# Altium schematic sheet Controller_Section.SchDoc
size A4
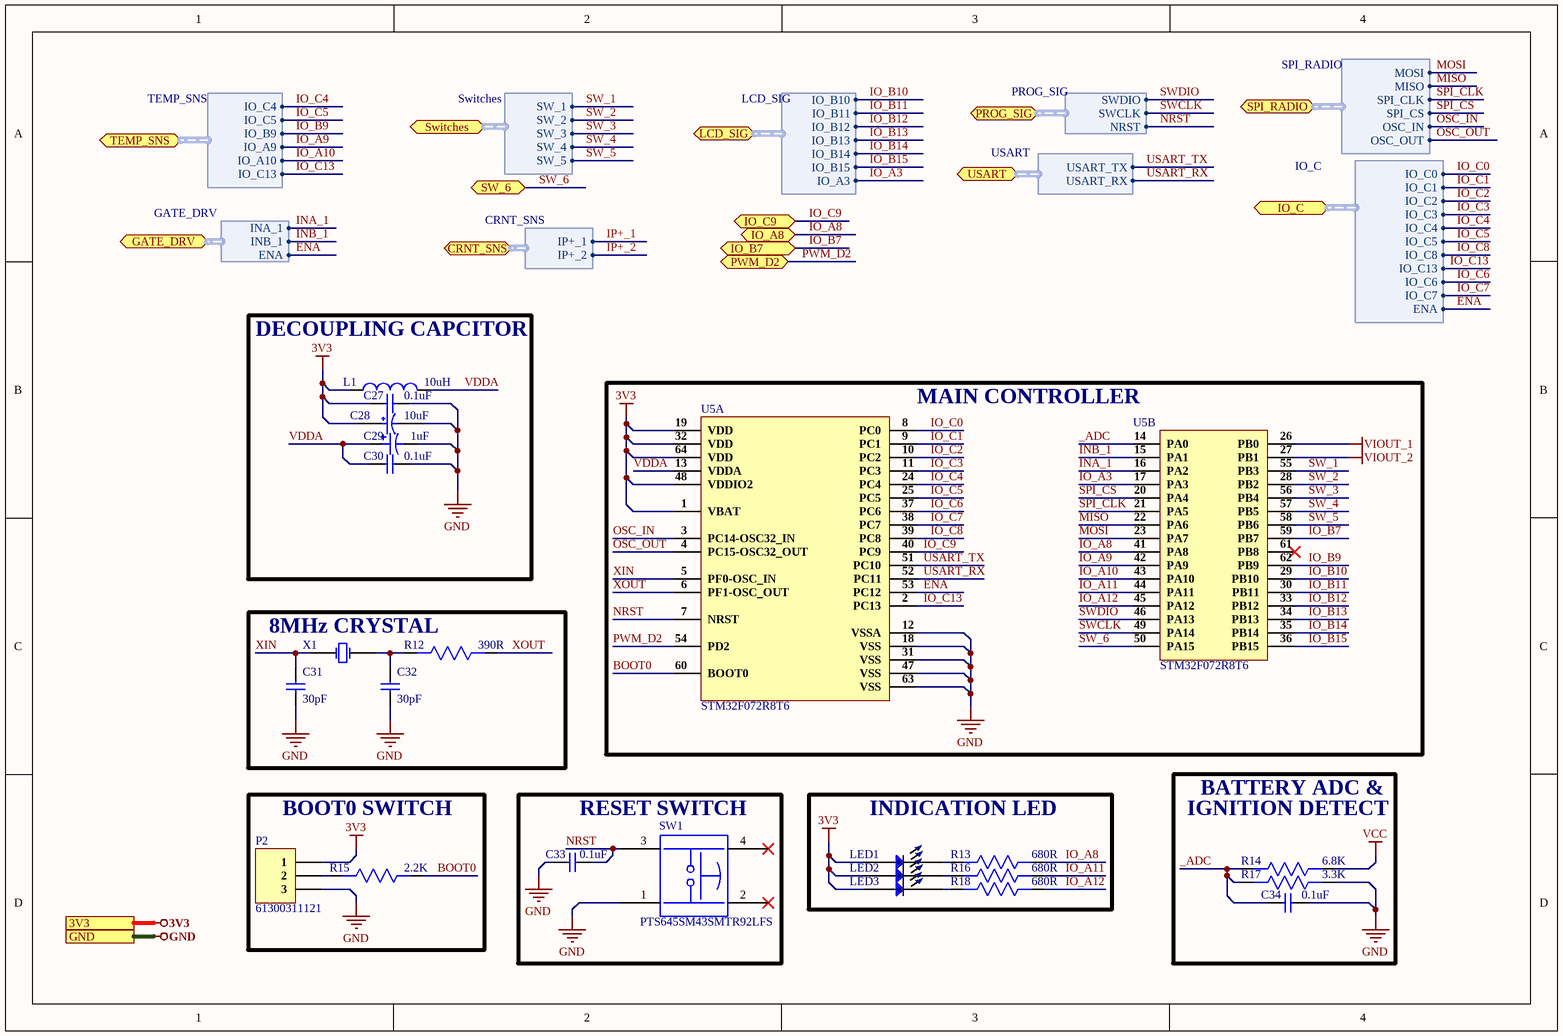
[diagram p0: Controller_Section.SchDoc]

## Parts
C27  0.1uF  [Cap0603]
C28  10uF  [RVT1E100M0405.]
C29  1uF  [F981E105MMA]
C30  0.1uF  [Cap0603]
C31  30pF  [Cap0603]
C32  30pF  [Cap0603]
C33  0.1uF  [Cap0603]
C34  0.1uF  [Cap0603]
L1  10uH  [Ind0805]
LED1  XZMDK68W-2  [LED 0402]  (value not drawn)
LED2  XZMDK68W-2  [LED 0402]  (value not drawn)
LED3  XZMDK68W-2  [LED 0402]  (value not drawn)
P2  61300311121  [HDR1X3]
R12  390R  [RES-0603]
R13  680R  [RES-0603]
R14  6.8K  [RES-0603]
R15  2.2K  [RES-0603]
R16  680R  [RES-0603]
R17  3.3K  [RES-0603]
R18  680R  [RES-0603]
SW1  PTS645SM43SMTR92LFS  [PTS645SM43SMTR92LFS]
U5  STM32F072R8T6  [64LQFP (10X10)]  (parts A,B of 2)
X1  9C-8.000MEEJ-T  [9C-8.000MEEJ-T]  (value not drawn)

## Blocks framed on the sheet
DECOUPLING CAPCITOR: C27-C30 L1
MAIN CONTROLLER: U5
8MHz CRYSTAL: C31 C32 R12 X1
BOOT0 SWITCH: P2 R15
RESET SWITCH: C33 SW1
INDICATION LED: LED1-LED3 R13 R16 R18

## Ports
3V3, CRNT_SNS (bidir, harness CRNT_SNS), GATE_DRV (bidir, harness GATE_DRV), GND, IO_A8 (bidir), IO_B7 (bidir), IO_C9 (bidir), IO_C (bidir, harness IO_C), LCD_SIG (bidir, harness LCD_SIG), PROG_SIG (bidir, harness PROG_SIG), PWM_D2 (bidir), SPI_RADIO (bidir, harness SPI_RADIO), SW_6 (bidir), Switches (bidir, harness Switches), TEMP_SNS (bidir, harness TEMP_SNS), USART (bidir, harness USART)

## Harnesses
Switches: SW_1, SW_2, SW_3, SW_4, SW_5
LCD_SIG: IO_B10, IO_B11, IO_B12, IO_B13, IO_B14, IO_B15, IO_A3
PROG_SIG: SWDIO, SWCLK, NRST
USART: USART_TX, USART_RX
CRNT_SNS: IP+_1, IP+_2
GATE_DRV: INA_1, INB_1, ENA
SPI_RADIO: SPI_CLK, MOSI, OSC_OUT, MISO, OSC_IN, SPI_CS
TEMP_SNS: IO_C4, IO_C5, IO_B9, IO_A9, IO_A10, IO_C13
IO_C: IO_C2, IO_C0, IO_C5, IO_C1, IO_C4, IO_C3, IO_C8, IO_C13, IO_C6, IO_C7, ENA

## Nets
3V3: C27.1 C28.1 L1.1 LED1.1 LED2.1 LED3.1 P2.1 U5.1(VBAT) U5.19(VDD) U5.32(VDD) U5.48(VDDIO2) U5.64(VDD) ; port 3V3
GND: C27.2 C28.2 C29.2 C30.2 C31.1 C32.1 C33.2 C34.2 P2.3 R17.1 SW1.1 U5.12(VSSA) U5.18(VSS) U5.31(VSS) U5.47(VSS) U5.63(VSS) ; port GND
VCC: R14.1
VIOUT_1: U5.26(PB0)
VIOUT_2: U5.27(PB1)
_ADC: C34.1 R14.2 R17.2 U5.14(PA0)
BOOT0: R15.1 U5.60(BOOT0)
ENA: U5.53(PC12) ; port GATE_DRV.ENA, port IO_C.ENA
INA_1: U5.16(PA2) ; port GATE_DRV.INA_1
INB_1: U5.15(PA1) ; port GATE_DRV.INB_1
IO_A3: U5.17(PA3) ; port LCD_SIG.IO_A3
IO_A8: R13.1 U5.41(PA8) ; port IO_A8
IO_A9: U5.42(PA9) ; port TEMP_SNS.IO_A9
IO_A10: U5.43(PA10) ; port TEMP_SNS.IO_A10
IO_A11: R16.1 U5.44(PA11)
IO_A12: R18.1 U5.45(PA12)
IO_B7: U5.59(PB7) ; port IO_B7
IO_B9: U5.62(PB9) ; port TEMP_SNS.IO_B9
IO_B10: U5.29(PB10) ; port LCD_SIG.IO_B10
IO_B11: U5.30(PB11) ; port LCD_SIG.IO_B11
IO_B12: U5.33(PB12) ; port LCD_SIG.IO_B12
IO_B13: U5.34(PB13) ; port LCD_SIG.IO_B13
IO_B14: U5.35(PB14) ; port LCD_SIG.IO_B14
IO_B15: U5.36(PB15) ; port LCD_SIG.IO_B15
IO_C0: U5.8(PC0) ; port IO_C.IO_C0
IO_C1: U5.9(PC1) ; port IO_C.IO_C1
IO_C2: U5.10(PC2) ; port IO_C.IO_C2
IO_C3: U5.11(PC3) ; port IO_C.IO_C3
IO_C4: U5.24(PC4) ; port TEMP_SNS.IO_C4, port IO_C.IO_C4
IO_C5: U5.25(PC5) ; port TEMP_SNS.IO_C5, port IO_C.IO_C5
IO_C6: U5.37(PC6) ; port IO_C.IO_C6
IO_C7: U5.38(PC7) ; port IO_C.IO_C7
IO_C8: U5.39(PC8) ; port IO_C.IO_C8
IO_C9: U5.40(PC9) ; port IO_C9
IO_C13: U5.2(PC13) ; port TEMP_SNS.IO_C13, port IO_C.IO_C13
IP+_1: port CRNT_SNS.IP+_1
IP+_2: port CRNT_SNS.IP+_2
MISO: U5.22(PA6) ; port SPI_RADIO.MISO
MOSI: U5.23(PA7) ; port SPI_RADIO.MOSI
NRST: C33.1 SW1.3 U5.7(NRST) ; port PROG_SIG.NRST
OSC_IN: U5.3(PC14-OSC32_IN) ; port SPI_RADIO.OSC_IN
OSC_OUT: U5.4(PC15-OSC32_OUT) ; port SPI_RADIO.OSC_OUT
PWM_D2: U5.54(PD2) ; port PWM_D2
SPI_CLK: U5.21(PA5) ; port SPI_RADIO.SPI_CLK
SPI_CS: U5.20(PA4) ; port SPI_RADIO.SPI_CS
SW_1: U5.55(PB3) ; port Switches.SW_1
SW_2: U5.28(PB2) ; port Switches.SW_2
SW_3: U5.56(PB4) ; port Switches.SW_3
SW_4: U5.57(PB5) ; port Switches.SW_4
SW_5: U5.58(PB6) ; port Switches.SW_5
SW_6: U5.50(PA15) ; port SW_6
SWCLK: U5.49(PA14) ; port PROG_SIG.SWCLK
SWDIO: U5.46(PA13) ; port PROG_SIG.SWDIO
USART_RX: U5.52(PC11) ; port USART.USART_RX
USART_TX: U5.51(PC10) ; port USART.USART_TX
VDDA: C29.1 C30.1 L1.2 U5.13(VDDA)
XIN: C31.2 U5.5(PF0-OSC_IN) X1.1(OSC1)
XOUT: R12.1 U5.6(PF1-OSC_OUT)
NetC32_2: C32.2 R12.2 X1.2(OSC2)
NetLED1_2: LED1.2 R13.2
NetLED2_2: LED2.2 R16.2
NetLED3_2: LED3.2 R18.2
NetP2_2: P2.2 R15.2

Not connected (* = marked no-connect by the designer): SW1 2* 4*; U5 61(PB8)*

## Notes on the sheet
- IGNITION DETECT
- BATTERY ADC &

## Library data of the parts
C27 C30 C33 C34 = CC0603ZRY5V9BB104: CAP CER 0.1UF 50V Y5V 0603; Manufacturer: Yageo; Capacitance: 100nF; Tolerance: 80%; Supplier 1: Digi-Key; Manufacturer Part Number: CC0603ZRY5V9BB104; Stock 1: 15000880; Pricing 1: 1=0.1, 10=0.075, 100=0.0334, 500=0.02386, 1000=0.01874 (USD); Mount: Surface Mount; Case/Package: 0603; Number of Pins: 2; Case Code (Metric): 1608; Case Code (Imperial): 0603; Min Operating Temperature: -30°C; Max Operating Temperature: 85°C; Dielectric: Y5V; Voltage Rating: 50V; Package Quantity: 1; Packaging: Tape and Reel; Voltage Rating (DC): 50V; Termination: SMD/SMT; Composition: Ceramic; Voltage: 50V; Length: 1.6mm; Height: 0.8mm; Width: 0.031inch; Thickness: 0.035inch; Depth: 0.8mm; Radiation Hardening: No; REACH SVHC: No SVHC; Lead Free: Lead Free; Halogen Free: Halogen Free; ComponentLink1URL: http://www.yageo.com/documents/recent/UPY-GPHC_Y5V_6.3V-to-50V_8.pdf?src-supplier=Digi-Key; ComponentLink1Description: http://www.yageo.com/documents/recent/UPY-GPHC_Y5V_6.3V-to-50V_8.pdf?src-supplier=Digi-Key; ComponentLink2URL: http://www.yageo.com/documents/recent/UPY-GPHC_Y5V_6.3V-to-50V_5.pdf?src-supplier=Avnet+Europe; ComponentLink2Description: http://www.yageo.com/documents/recent/UPY-GPHC_Y5V_6.3V-to-50V_5.pdf?src-supplier=Avnet+Europe; ComponentLink3URL: https://www.verical.com/server-webapp/html/getDatasheet?partID=403611&src-supplier=Verical; ComponentLink3Description: https://www.verical.com/server-webapp/html/getDatasheet?partID=403611&src-supplier=Verical; ComponentLink4URL: http://www.mouser.com/ds/2/447/Yageo_UPY-GP_NP0_16V-to-50V_9-358835.pdf?src-supplier=Mouser; ComponentLink4Description: http://www.mouser.com/ds/2/447/Yageo_UPY-GP_NP0_16V-to-50V_9-358835.pdf?src-supplier=Mouser; ComponentLink5URL: http://www.farnell.com/datasheets/1132289.pdf?src-supplier=Element14; ComponentLink5Description: http://www.farnell.com/datasheets/1132289.pdf?src-supplier=Element14; Supplier Part Number 1: 311-1343-1-ND
C28 = RVT1E100M0405: CAP ALUM 10uF 25V SMD; Manufacturer: ROQANG; φD: 4mm; L: 5.4mm; Tolerance: ±20%; Operating Temperature: -45℃~+105℃; Rated Voltage: 25V; Capacitance: 10uF
C29 = F981E105MMA: CAP TANT 1UF 20% 25V 0603; Manufacturer: Kyocera AVX; ESR (Equivalent Series Resistance): 10R; Supplier 1: Digi-Key; Manufacturer Part Number: F981E105MMA; RoHS: Yes; Category: Tantalum Capacitors; Stock 1: 11167; Pricing 1: 1=0.79000, 10=0.55800, 50=0.42220, 100=0.36770, 500=0.27236, 1000=0.23151 (USD); Mount: Surface Mount; Case/Package: 0603; Min Operating Temperature: -55°C; Max Operating Temperature: 125°C; Features: General Purpose; Packaging: Tape and Reel; Capacitance: 1uF; Tolerance: 20%; Voltage Rating: 25V; RoHS Compliant: Yes; ComponentLink1URL: http://www.mouser.com/ds/2/40/f98-775787.pdf?src-supplier=Mouser; ComponentLink1Description: http://www.mouser.com/ds/2/40/f98-775787.pdf?src-supplier=Mouser; ComponentLink2URL: http://www.farnell.com/datasheets/2096554.pdf?src-supplier=Newark; ComponentLink2Description: http://www.farnell.com/datasheets/2096554.pdf?src-supplier=Newark; ComponentLink3URL: http://datasheets.avx.com/F98.pdf?src-supplier=Digi-Key; ComponentLink3Description: http://datasheets.avx.com/F98.pdf?src-supplier=Digi-Key; Supplier Part Number 1: 478-8658-1-ND
C31 C32 = CC0603JRNPO9BN300: CAP 30pF NP0 0603 50 V ±5 % SMD; Manufacturer: Yageo; Tolerance: 5%; Dielectric: C0G; Voltage Rating: 50V; Dissipation Factor: 0.1%; Insulation Resistance: 10GR; Supplier 1: Digi-Key; Manufacturer Part Number: CC0603JRNPO9BN300; RoHS: Yes; Category: Ceramic Capacitors; Stock 1: 36700; Pricing 1: 1=0.10000, 10=0.06800, 50=0.03700, 100=0.03020, 500=0.02160, 1000=0.01697 (USD); Mount: Surface Mount; Case/Package: 0603; Number of Pins: 2; Case Code (Imperial): 0603; Case Code (Metric): 1608; Weight: 7.1E-05oz; Min Operating Temperature: -55°C; Max Operating Temperature: 125°C; Capacitance: 30pF; Packaging: Tape and Reel; Voltage Rating (DC): 50V; Termination: SMD/SMT; Resistor Type: Ceramic; Series: CC; Construction: Flat; Length: 1.6mm; Width: 0.031inch; Height: 0.8mm; Thickness: 0.035inch; Depth: 0.8mm; Radiation Hardening: No; REACH SVHC: No SVHC; Lead Free: Lead Free; RoHS Compliant: Yes; ComponentLink1URL: https://datasheet.ciiva.com/26862/getdatasheetpartid-403531-26862766.pdf?src-supplier=Verical; ComponentLink1Description: https://datasheet.ciiva.com/26862/getdatasheetpartid-403531-26862766.pdf?src-supplier=Verical; ComponentLink2URL: https://datasheet.ciiva.com/13264/upy-gp-np0-16v-to-50v-8-3714-13264406.pdf?src-supplier=Mouser; ComponentLink2Description: https://datasheet.ciiva.com/13264/upy-gp-np0-16v-to-50v-8-3714-13264406.pdf?src-supplier=Mouser; ComponentLink3URL: https://datasheet.ciiva.com/7978/1132289-7978140.pdf?src-supplier=Element14; ComponentLink3Description: https://datasheet.ciiva.com/7978/1132289-7978140.pdf?src-supplier=Element14; ComponentLink4URL: https://datasheet.ciiva.com/28450/1443161-28450494.pdf?src-supplier=Element14; ComponentLink4Description: https://datasheet.ciiva.com/28450/1443161-28450494.pdf?src-supplier=Element14; Supplier Part Number 1: 311-3357-1-ND
L1 = MGFL2012F100MT-LF: 500mA 10uH ±20% 320mΩ 0805 Inductors; Manufacturer: Microgate; Manufacturer Part No:: MGFL2012F100MT-LF; Value: 10uH; Package: 0805; ComponentLink1Description: New link; ComponentLink1URL: https://lcsc.com/product-detail/Inductors-SMD_microgate-MGFL2012F100MT-LF_C281113.html
LED1-LED3 = XZMDK68W-2: LED RED CLEAR CHIP SMD; Manufacturer: SunLED; Lens Color: Colorless; Luminous Intensity: 69mcd; Test Current: 20mA; Viewing Angle: 120°; Dominant Wavelength: 630nm; Forward Voltage: 1.95V; Supplier 1: Digi-Key; Manufacturer Part Number: XZMDK68W-2; Stock 1: 69539; Pricing 1: 1=0.43, 10=0.306, 100=0.136, 500=0.0952, 1000=0.0782 (USD); Mount: Surface Mount; Case/Package: 0402; Color: Red; Case Code (Metric): 1005; Case Code (Imperial): 0402; Packaging: Tape and Reel; Lens Transparency: Clear; Length: 1mm; Height: 0.6mm; Width: 0.5mm; ComponentLink1URL: http://www.sunledusa.com/products/spec/XZMDK68W-2.pdf?src-supplier=Digi-Key; ComponentLink1Description: http://www.sunledusa.com/products/spec/XZMDK68W-2.pdf?src-supplier=Digi-Key; ComponentLink2URL: https://www.sunledusa.com/products/spec/XZMDK68W-2.pdf?src-supplier=Digi-Key; ComponentLink2Description: https://www.sunledusa.com/products/spec/XZMDK68W-2.pdf?src-supplier=Digi-Key; Supplier Part Number 1: 1497-1174-6-ND
P2 = Header 1X3: CONN HEADER VERT 3POS 2.54MM; Manufacturer: Wurth Electronics; Number of Positions: 3; Gender: Male; Connector Type: Male Pin; Pitch: 0.1inch; Supplier 1: Digi-Key; Manufacturer Part Number: 61300311121; Stock 1: 81286; Pricing 1: 1=0.13, 10=0.106, 25=0.088, 50=0.074, 100=0.067, 1000=0.061 (USD); Mount: Through Hole; Contact Plating: Gold; Contact Material: Copper; Color: Black; Number of Rows: 1; Packaging: Bulk; Termination: Solder; Number of Contacts: 3; Contact Mating Length: 0.236inch; REACH SVHC: Unknown; Lead Free: Lead Free; ComponentLink1URL: http://www.farnell.com/cad/1737268.pdf?src-supplier=Element14; ComponentLink1Description: http://www.farnell.com/cad/1737268.pdf?src-supplier=Element14; ComponentLink2URL: https://katalog.we-online.de/em/datasheet/6130xx11121.pdf?src-supplier=Digi-Key; ComponentLink2Description: https://katalog.we-online.de/em/datasheet/6130xx11121.pdf?src-supplier=Digi-Key; Supplier Part Number 1: 732-5316-ND
R12 = RC0603JR-07390RL: RES SMD 390 OHM 5% 1/10W 0603; Manufacturer: Yageo; Voltage Rating: 50V; Power Rating: 100mW; Temperature Coefficient: 100ppm/°C; Working Voltage: 75V; Supplier 1: Digi-Key; Manufacturer Part Number: RC0603JR-07390RL; Stock 1: 1598874; Pricing 1: 1=0.1, 10=0.02, 100=0.0081, 1000=0.00362, 2500=0.00314 (USD); Case/Package: 0603; Number of Pins: 2; Case Code (Imperial): 0603; Case Code (Metric): 1608; Min Operating Temperature: -55°C; Max Operating Temperature: 155°C; Voltage Rating (DC): 50V; Resistance: 390R; Tolerance: 5%; Packaging: Tape and Reel; Package Quantity: 1; Termination: SMD/SMT; Composition: Thick Film; Number of Terminations: 2; Military Standard: Not; Max Power Dissipation: 100mW; Features: Moisture Resistant; Length: 1.6mm; Height: 0.022inch; Width: 0.8mm; Depth: 0.8mm; REACH SVHC: No SVHC; Lead Free: Lead Free; ComponentLink1URL: http://www.yageo.com.tw/exep/pages/download/literatures/PYu-R_INT-thick_7.pdf?src-supplier=Digi-Key; ComponentLink1Description: http://www.yageo.com.tw/exep/pages/download/literatures/PYu-R_INT-thick_7.pdf?src-supplier=Digi-Key; ComponentLink2URL: http://www.yageo.com/documents/recent/PYu-RC_Group_51_RoHS_L_10.pdf?src-supplier=Digi-Key; ComponentLink2Description: http://www.yageo.com/documents/recent/PYu-RC_Group_51_RoHS_L_10.pdf?src-supplier=Digi-Key; ComponentLink3URL: http://www.yageo.com/documents/recent/PYu-RC_Group_51_RoHS_L_9.pdf?src-supplier=Digi-Key; ComponentLink3Description: http://www.yageo.com/documents/recent/PYu-RC_Group_51_RoHS_L_9.pdf?src-supplier=Digi-Key; ComponentLink4URL: http://www.farnell.com/datasheets/443971.pdf?src-supplier=Element14; ComponentLink4Description: http://www.farnell.com/datasheets/443971.pdf?src-supplier=Element14; Supplier Part Number 1: 311-390GRCT-ND
R13 R16 R18 = RC0603FR-07680RL: RES SMD 680 OHM 1% 1/10W 0603; Manufacturer: Yageo; Temperature Coefficient: 100ppm/°C; Voltage Rating (DC): 50V; Power Rating: 100mW; Supplier 1: Digi-Key; Manufacturer Part Number: RC0603FR-07680RL; Stock 1: 4278227; Pricing 1: 1=0.1, 10=0.024, 100=0.0097, 1000=0.00437, 2500=0.00379 (USD); Case/Package: 0603; Number of Pins: 2; Case Code (Imperial): 0603; Case Code (Metric): 1608; Min Operating Temperature: -55°C; Max Operating Temperature: 155°C; Resistance: 680R; Tolerance: 1%; Composition: Thick Film; Packaging: Tape and Reel; Number of Terminations: 2; Military Standard: Not; Voltage Rating: 50V; Package Quantity: 1; Termination: SMD/SMT; Max Power Dissipation: 100mW; Features: Moisture Resistant; Length: 1.6mm; Height: 0.022inch; Width: 0.031inch; Depth: 0.8mm; REACH SVHC: No SVHC; Lead Free: Lead Free; ComponentLink1URL: http://www.farnell.com/datasheets/1868787.pdf?src-supplier=Element14; ComponentLink1Description: http://www.farnell.com/datasheets/1868787.pdf?src-supplier=Element14; ComponentLink2URL: http://documents.rs-components.com/techlib://itc_doclist_GB.htm?stockno=5048221&src-supplier=RSComponents; ComponentLink2Description: http://documents.rs-components.com/techlib://itc_doclist_GB.htm?stockno=5048221&src-supplier=RSComponents; ComponentLink3URL: http://www.farnell.com/datasheets/443971.pdf?src-supplier=Element14; ComponentLink3Description: http://www.farnell.com/datasheets/443971.pdf?src-supplier=Element14; ComponentLink4URL: http://www.yageo.com/documents/recent/PYu-RC_Group_51_RoHS_L_10.pdf?src-supplier=Digi-Key; ComponentLink4Description: http://www.yageo.com/documents/recent/PYu-RC_Group_51_RoHS_L_10.pdf?src-supplier=Digi-Key; Supplier Part Number 1: 311-680HRCT-ND
R14 = CRCW06036K80JNEA: RES SMD 6.8K OHM 5% 1/10W 0603; Manufacturer: Vishay Dale; Resistance: 6.8kR; Power Rating: 100mW; Voltage Rating: 75V; Temperature Coefficient: 200ppm/°C; Supplier 1: Digi-Key; Manufacturer Part Number: CRCW06036K80JNEA; RoHS: Yes; Category: Chip SMD Resistors; Stock 1: 38850; Pricing 1: 1=0.10000, 10=0.03300, 100=0.01360, 1000=0.00610, 2500=0.00529 (USD); Case/Package: 0603; Case Code (Imperial): 0603; Case Code (Metric): 1608; Weight: 7.1E-05oz; Contact Plating: Tin; Size Code: 0603; Min Operating Temperature: -55°C; Max Operating Temperature: 155°C; Tolerance: 5%; Packaging: Tape and Reel; Termination: SMD/SMT; Resistor Type: Thick Film; Series: CRCW; Package Quantity: 1; Number of Terminations: 2; Max Power Dissipation: 100mW; Voltage Rating (DC): 75V; Features: Automotive AEC-Q200; Technology: THICK FILM; Resistance Tolerance: 5%; Construction: Rectangular; Length: 1.55mm; Width: 0.85mm; Height: 0.45mm; Depth: 0.85mm; Radiation Hardening: No; RoHS Compliant: Yes; Lead Free: Lead Free; REACH SVHC: Unknown; Military Standard: Not; ComponentLink1URL: https://datasheet.ciiva.com/2493/dcrcwe3-2493715.pdf?src-supplier=Digi-Key; ComponentLink1Description: https://datasheet.ciiva.com/2493/dcrcwe3-2493715.pdf?src-supplier=Digi-Key; ComponentLink2URL: https://datasheet.ciiva.com/2493/dcrcwe3-2493716.pdf?src-supplier=Digi-Key; ComponentLink2Description: https://datasheet.ciiva.com/2493/dcrcwe3-2493716.pdf?src-supplier=Digi-Key; ComponentLink3URL: https://datasheet.ciiva.com/2493/dcrcwe3-2493717.pdf?src-supplier=Digi-Key; ComponentLink3Description: https://datasheet.ciiva.com/2493/dcrcwe3-2493717.pdf?src-supplier=Digi-Key; ComponentLink4URL: https://datasheet.ciiva.com/28542/1747939-28542618.pdf?src-supplier=Element14; ComponentLink4Description: https://datasheet.ciiva.com/28542/1747939-28542618.pdf?src-supplier=Element14; ComponentLink5URL: https://datasheet.ciiva.com/3257/dcrcwe3-3257854.pdf?src-supplier=Avnet; ComponentLink5Description: https://datasheet.ciiva.com/3257/dcrcwe3-3257854.pdf?src-supplier=Avnet; Supplier Part Number 1: 541-6.8KGCT-ND
R15 = RC0603FR-072K2L: RES SMD 2.2K OHM 1% 1/10W 0603; Manufacturer: Yageo Phycomp; Temperature Coefficient: 100ppm/°C; Resistance: 2.2kR; Power Rating: 100mW; Voltage Rating (DC): 50V; Supplier 1: Digi-Key; Manufacturer Part Number: RC0603FR-072K2L; Stock 1: 10587920; Pricing 1: 1=0.1, 10=0.023, 100=0.0094, 1000=0.00421, 2500=0.00366 (USD); Mount: Surface Mount; Case/Package: 0603; Number of Pins: 2; Min Operating Temperature: -55°C; Max Operating Temperature: 155°C; Tolerance: 1%; Packaging: Cut Tape; Length: 1.6mm; Height: 0.45mm; Width: 800um; Depth: 0.8mm; REACH SVHC: No SVHC; Lead Free: Lead Free; Supplier Part Number 1: 311-2.20KHRCT-ND
R17 = RC0603FR-073K3L: RES SMD 3.3K OHM 1% 1/10W 0603; Manufacturer: Yageo Phycomp; Temperature Coefficient: 100ppm/°C; Resistance: 3.3kR; Voltage Rating (DC): 50V; Power Rating: 100mW; Supplier 1: Digi-Key; Manufacturer Part Number: RC0603FR-073K3L; Stock 1: 6863000; Pricing 1: 1=0.1, 10=0.024, 100=0.0097, 1000=0.00437, 2500=0.00379 (USD); Mount: Surface Mount; Case/Package: 0603; Number of Pins: 2; Min Operating Temperature: -55°C; Max Operating Temperature: 155°C; Tolerance: 1%; Packaging: Cut Tape; Length: 1.6mm; Height: 0.45mm; Width: 800um; Depth: 0.8mm; REACH SVHC: No SVHC; Lead Free: Lead Free; Supplier Part Number 1: 311-3.30KHRCT-ND
SW1 = PTS645SM43SMTR92LFS: SWITCH TACTILE SPST-NO 0.05A 12V; Manufacturer: ITT C&K; Mechanical Life: 100000Cycles; Actuator Material: Nylon,Polyamide,PA66; Throw Configuration: SPST; Operating Force: 160gf; Contact Resistance: 100mR; Max Current Rating: 50mA; Illumination Type: Non-Illuminated,Illuminated; Switch Function: Off-Mom; Actuator Type: Standard; Actuator Length: 0.85mm; Supplier 1: Digi-Key; Manufacturer Part Number: PTS645SM43SMTR92LFS; RoHS: Yes; Category: Tactile Switches; Stock 1: 1002899; Pricing 1: 1=0.26000, 10=0.25100, 25=0.23840, 100=0.21580, 250=0.19676, 500=0.18288 (USD); Mount: Surface Mount; Case/Package: SMD/SMT; Contact Plating: Silver; Contact Material: Silver; Color: Black; Min Operating Temperature: -20°C; Max Operating Temperature: 60°C; Max Voltage Rating (DC): 12V; Packaging: Tape and Reel; Termination: Gull Wing; Package Quantity: 1; Current Rating: 50mA; Voltage Rating (DC): 12V; Orientation: Straight; Series: PTS645; Length: 6mm; Depth: 9mm; Size: 6mm; Lead Free: Lead Free; RoHS Compliant: Yes; REACH SVHC: No SVHC; ComponentLink1URL: https://datasheet.ciiva.com/29903/getdatasheetpartid-786341-29903846.pdf?src-supplier=Verical; ComponentLink1Description: https://datasheet.ciiva.com/29903/getdatasheetpartid-786341-29903846.pdf?src-supplier=Verical; ComponentLink2URL: https://datasheet.ciiva.com/29931/getdatasheetpartid-764615-29931183.pdf?src-supplier=Verical; ComponentLink2Description: https://datasheet.ciiva.com/29931/getdatasheetpartid-764615-29931183.pdf?src-supplier=Verical; ComponentLink3URL: https://datasheet.ciiva.com/14920/pts645-14920733.pdf?src-supplier=Digi-Key; ComponentLink3Description: https://datasheet.ciiva.com/14920/pts645-14920733.pdf?src-supplier=Digi-Key; ComponentLink4URL: https://datasheet.ciiva.com/14920/pts645-14920734.pdf?src-supplier=Digi-Key; ComponentLink4Description: https://datasheet.ciiva.com/14920/pts645-14920734.pdf?src-supplier=Digi-Key; ComponentLink5URL: https://datasheet.ciiva.com/14920/pts645-14920735.pdf?src-supplier=Digi-Key; ComponentLink5Description: https://datasheet.ciiva.com/14920/pts645-14920735.pdf?src-supplier=Digi-Key; Supplier Part Number 1: CKN9112CT-ND
U5 = STM32F072R8T6: IC MCU 32BIT 64KB FLASH 64LQFP; Manufacturer: STMicroelectronics; RAM Size: 16KB; Max Power Dissipation: 455mW; Interface: I2C,SPI,USB,CAN,HDMI,IrDA,UART,USART,LIN,I2S; Number of I/Os: 51; Number of Timers/Counters: 9; Frequency: 48MHz; Oscillator Type: Internal; Max Supply Voltage: 3.6V; Min Supply Voltage: 2V; Data Bus Width: 32b; Watchdog Timer: Yes; Peripherals: POR,PWM,WDT,DMA; Core Architecture: ARM; Supplier 1: Digi-Key; Manufacturer Part Number: STM32F072R8T6; RoHS: Yes; Category: Microcontrollers; Pricing 1: 1=5.28000, 10=4.73900, 25=4.48040, 160=3.88300, 320=3.68388, 480=3.31879 (USD); Mount: Surface Mount; Case/Package: LQFP; Number of Pins: 64; Contact Plating: Tin,Matte; Min Operating Temperature: -40°C; Max Operating Temperature: 85°C; Packaging: Tray; Number of Programmable I/O: 51; Max Frequency: 48MHz; Memory Type: FLASH; Memory Size: 64KB; Lead Free: Lead Free; RoHS Compliant: Yes; ComponentLink1URL: https://datasheet.ciiva.com/48492/dm00090510-48492508.pdf?src-supplier=Avnet; ComponentLink1Description: https://datasheet.ciiva.com/48492/dm00090510-48492508.pdf?src-supplier=Avnet; Supplier Part Number 1: 497-17361-ND
X1 = 9C-8.000MEEJ-T: CRYSTAL 8.0000MHZ 18PF SMD